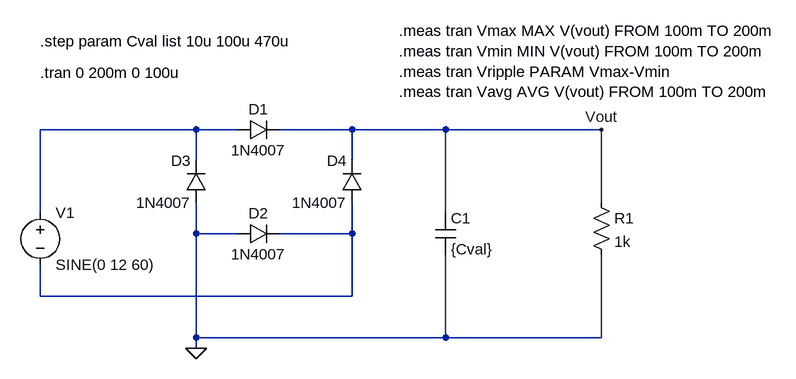
[diagram p0: schematic W02_D05_Rectifier_SmoothingCap.asc]
W02_D05_Rectifier_SmoothingCap.asc, the LTspice schematic file:
Version 4.1
SHEET 1 1180 680
WIRE 256 32 16 32
WIRE 320 32 256 32
WIRE 496 32 384 32
WIRE 640 32 496 32
WIRE 880 32 640 32
WIRE 256 80 256 32
WIRE 496 80 496 32
WIRE 880 144 880 32
WIRE 16 160 16 32
WIRE 640 160 640 32
WIRE 256 192 256 144
WIRE 320 192 256 192
WIRE 496 192 496 144
WIRE 496 192 384 192
WIRE 16 288 16 240
WIRE 496 288 496 192
WIRE 496 288 16 288
WIRE 256 352 256 192
WIRE 640 352 640 224
WIRE 640 352 256 352
WIRE 880 352 880 224
WIRE 880 352 640 352
WIRE 256 368 256 352
FLAG 256 368 0
FLAG 880 32 Vout
SYMBOL voltage 16 144 R0
SYMATTR InstName V1
SYMATTR Value SINE(0 12 60)
SYMBOL diode 320 48 R270
WINDOW 0 32 32 VTop 2
WINDOW 3 0 32 VBottom 2
SYMATTR InstName D1
SYMATTR Value 1N4007
SYMBOL diode 320 208 R270
WINDOW 0 32 32 VTop 2
WINDOW 3 0 32 VBottom 2
SYMATTR InstName D2
SYMATTR Value 1N4007
SYMBOL diode 272 144 R180
WINDOW 0 24 64 Left 2
WINDOW 3 24 0 Left 2
SYMATTR InstName D3
SYMATTR Value 1N4007
SYMBOL diode 512 144 R180
WINDOW 0 24 64 Left 2
WINDOW 3 24 0 Left 2
SYMATTR InstName D4
SYMATTR Value 1N4007
SYMBOL res 864 128 R0
SYMATTR InstName R1
SYMATTR Value 1k
SYMBOL cap 624 160 R0
SYMATTR InstName C1
SYMATTR Value {Cval}
TEXT 16 -56 Left 2 !.tran 0 200m 0 100u
TEXT 16 -104 Left 2 !.step param Cval list 10u 100u 470u
TEXT 568 -120 Left 2 !.meas tran Vmax MAX V(vout) FROM 100m TO 200m\n.meas tran Vmin MIN V(vout) FROM 100m TO 200m\n.meas tran Vripple PARAM Vmax-Vmin\n.meas tran Vavg AVG V(vout) FROM 100m TO 200m

The netlist it stands for:
* W02_D05_Rectifier_SmoothingCap.asc
V1 N001 N002 SINE(0 12 60)
D1 N001 Vout 1N4007
D2 0 N002 1N4007
D3 0 N001 1N4007
D4 N002 Vout 1N4007
R1 Vout 0 1k
C1 Vout 0 {Cval}
.model D D
.lib standard.dio
.tran 0 200m 0 100u
.step param Cval list 10u 100u 470u
.meas tran Vmax MAX V(vout) FROM 100m TO 200m
.meas tran Vmin MIN V(vout) FROM 100m TO 200m
.meas tran Vripple PARAM Vmax-Vmin
.meas tran Vavg AVG V(vout) FROM 100m TO 200m
.backanno
.end